# Altium schematic sheet Top.SchDoc
size B; SheetNumber: 1; SheetTotal: 6
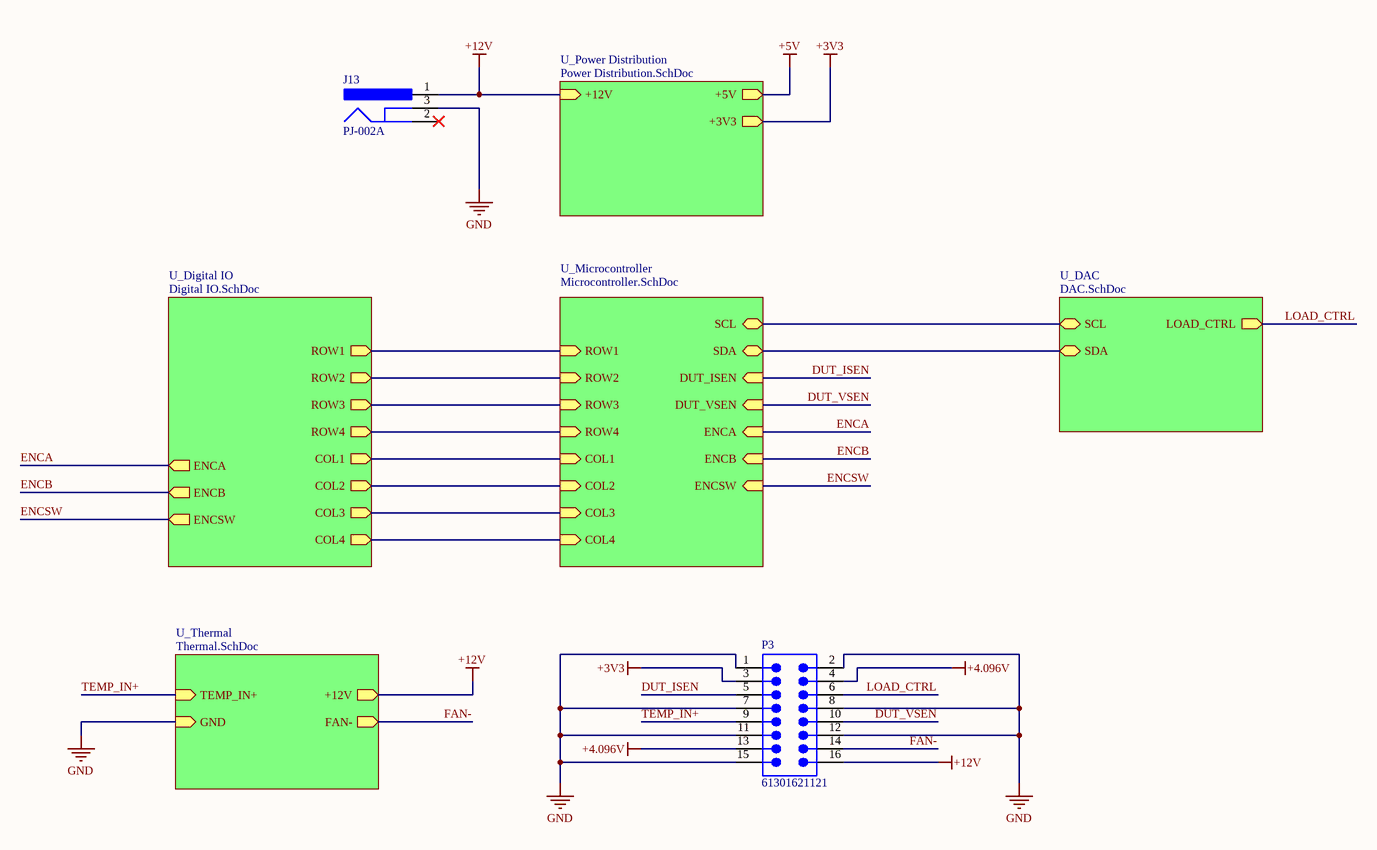
[diagram p0: Top.SchDoc]

## Parts
J13  PJ-002A  [CUI-PJ-002A_V]
P3  61301621121  [61301621121]

## Sub-sheets
U_DAC = DAC.SchDoc: SCL (bidir), SDA (bidir), LOAD_CTRL (out)
U_Digital IO = Digital IO.SchDoc: ROW1 (out), ROW2 (out), ROW3 (out), ROW4 (out), COL1 (out), COL2 (out), COL3 (out), COL4 (out), ENCA (out), ENCB (out), ENCSW (out)
U_Microcontroller = Microcontroller.SchDoc: DUT_ISEN (in), DUT_VSEN (in), ROW1 (in), ROW2 (in), ROW3 (in), ROW4 (in), ENCA (in), ENCB (in), ENCSW (in), COL1 (in), COL2 (in), COL3 (in), COL4 (in), SCL (bidir), SDA (bidir)
U_Power Distribution = Power Distribution.SchDoc: +12V (in), +5V (out), +3V3 (out)
U_Thermal = Thermal.SchDoc: FAN- (out), TEMP_IN+ (in), +12V (out), GND (in)

## Nets
+3V3: P3.3 ; sheet U_Power Distribution/+3V3
+4.096V: P3.4 P3.13
+5V: sheet U_Power Distribution/+5V
+12V: J13.1 P3.16 ; sheet U_Power Distribution/+12V, sheet U_Thermal/+12V
GND: J13.3 P3.1 P3.2 P3.7 P3.8 P3.11 P3.12 P3.15 ; sheet U_Thermal/GND
DUT_ISEN: P3.5 ; sheet U_Microcontroller/DUT_ISEN
DUT_VSEN: P3.10 ; sheet U_Microcontroller/DUT_VSEN
ENCA: sheet U_Digital IO/ENCA, sheet U_Microcontroller/ENCA
ENCB: sheet U_Digital IO/ENCB, sheet U_Microcontroller/ENCB
ENCSW: sheet U_Digital IO/ENCSW, sheet U_Microcontroller/ENCSW
FAN-: P3.14 ; sheet U_Thermal/FAN-
LOAD_CTRL: P3.6 ; sheet U_DAC/LOAD_CTRL
TEMP_IN+: P3.9 ; sheet U_Thermal/TEMP_IN+
(unnamed): sheet U_DAC/SCL, sheet U_Microcontroller/SCL
(unnamed): sheet U_DAC/SDA, sheet U_Microcontroller/SDA
(unnamed): sheet U_Digital IO/ROW1, sheet U_Microcontroller/ROW1
(unnamed): sheet U_Digital IO/ROW2, sheet U_Microcontroller/ROW2
(unnamed): sheet U_Digital IO/ROW3, sheet U_Microcontroller/ROW3
(unnamed): sheet U_Digital IO/ROW4, sheet U_Microcontroller/ROW4
(unnamed): sheet U_Digital IO/COL1, sheet U_Microcontroller/COL1
(unnamed): sheet U_Digital IO/COL2, sheet U_Microcontroller/COL2
(unnamed): sheet U_Digital IO/COL3, sheet U_Microcontroller/COL3
(unnamed): sheet U_Digital IO/COL4, sheet U_Microcontroller/COL4

Not connected (* = marked no-connect by the designer): J13 2*

## Library data of the parts
J13 = CMP-2000-06895-2: Through Hole Right Angle DC Power Jack, 2.5 A, 2 mm Center Pin, 3 Position, -25 to 85 degC, RoHS, Bulk; Manufacturer: CUIInc.; Brand: CUI; Inside Contact Diameter: 2mm; Voltage Rating: 24V; Outside Contact Diameter: 6.5mm; Current Rating: 2.5A; Insulation Resistance: 50MOhms; Contact Gender: Male; Connector Type: DCPowerJack; Datasheet Version: Rev. 1.03, 04/2016; Housing Material: PolybutyleneTerephthalate(PBT); Operating Temperature Range: -25Cto+85C; Termination Style: ThroughHole; Product Category: DCPowerConnectors; Mounting Technology: ThroughHole; Mounting Style: ThroughHole; Factory Pack Quantity: 500; Contact Plating: Nickel; Package Reference: PJ-002A; Mounting Angle: Right; Package Description: 3-Pin Through Hole Device, Body 14.4 x 9 mm, Height 11 mm; Flammability Rating: UL94V-0; Manufacturer URL: http://www.cui.com/; Product: Jacks; Contact Material: Copper; Datasheet URL: http://www.cui.com/product/resource/pj-002a.pdf; RoHS: True
P3 = CMP-1502-01097-3: NexarPartId: 32855550; Contact Resistance: 20mΩ; Operating Supply Voltage: 250V; Number of Contacts: 16; Current Rating: 3A; Connector Type: Male Pin; Row Spacing: 2.54mm; Gender: Male; Min Operating Temperature: -40°C; Contact Material: Copper; RoHS: Compliant; Lead Pitch: 2.54mm; Color: Black; Contact Mating Length: 5.9944mm; REACH SVHC: Unknown; Number of Rows: 2; Orientation: Vertical; Number of Positions: 16; Max Operating Temperature: 105°C; Termination: Solder; Packaging: Bulk; Height: 8.89mm; Mount: Through Hole; Contact Plating: Gold; Voltage Rating: 250V; Number of Pins: 16; Pitch: 2.54mm